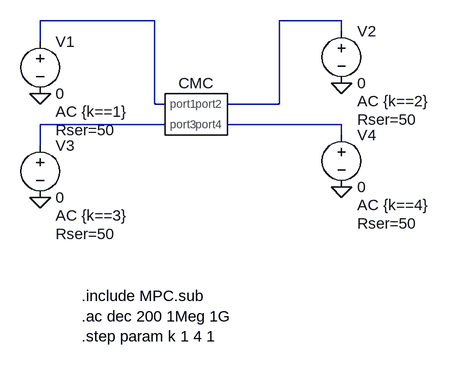
[diagram p0: schematic MPC_testbench.asc]
MPC_testbench.asc, the LTspice schematic file:
Version 4.1
SHEET 1 944 680
WIRE 496 -32 320 -32
WIRE 784 -32 688 -32
WIRE 784 -16 784 -32
WIRE 320 0 320 -32
WIRE 496 96 496 -32
WIRE 512 96 496 96
WIRE 688 96 688 -32
WIRE 688 96 608 96
WIRE 512 128 320 128
WIRE 784 128 608 128
WIRE 784 144 784 128
WIRE 320 160 320 128
FLAG 320 80 0
FLAG 784 64 0
FLAG 320 240 0
FLAG 784 224 0
SYMBOL voltage 320 -16 R0
WINDOW 123 24 124 Left 2
WINDOW 39 24 152 Left 2
SYMATTR InstName V1
SYMATTR Value 0
SYMATTR Value2 AC {k==1}
SYMATTR SpiceLine Rser=50
SYMBOL voltage 784 -32 R0
WINDOW 123 24 124 Left 2
WINDOW 39 24 152 Left 2
SYMATTR InstName V2
SYMATTR Value 0
SYMATTR Value2 AC {k==2}
SYMATTR SpiceLine Rser=50
SYMBOL voltage 320 144 R0
WINDOW 123 24 124 Left 2
WINDOW 39 24 152 Left 2
SYMATTR InstName V3
SYMATTR Value 0
SYMATTR Value2 AC {k==3}
SYMATTR SpiceLine Rser=50
SYMBOL voltage 784 128 R0
WINDOW 123 24 124 Left 2
WINDOW 39 24 152 Left 2
SYMATTR InstName V4
SYMATTR Value 0
SYMATTR Value2 AC {k==4}
SYMATTR SpiceLine Rser=50
SYMBOL MPC 560 112 R0
SYMATTR InstName CMC
SYMATTR SpiceModel MPC
SYMATTR SpiceLine LC=1.31934e-05 CC=1e-14 RC=2336.9 LD=5.72264e-07 CD=5.62282e-13 RD=1269.4 CW=1.14048e-12 Lw=1e-12 Cwt=1e-15 Rw=1e+06 Rcr=50.9365 Ccr=7.04504e-13 Rrl=2311.47 Lrl=1.59245e-05 Cg=2.7001e-13 RDC=1e-06
SYMATTR Prefix X
TEXT 384 392 Left 2 !.include MPC.sub\n.ac dec 200 1Meg 1G\n.step param k 1 4 1

The netlist it stands for:
* MPC_testbench.asc
V1 N001 0 0 AC {k==1} Rser=50
V2 N002 0 0 AC {k==2} Rser=50
V3 N003 0 0 AC {k==3} Rser=50
V4 N004 0 0 AC {k==4} Rser=50
X§CMC N001 N002 N003 N004 MPC LC=1.31934e-05 CC=1e-14 RC=2336.9 LD=5.72264e-07 CD=5.62282e-13 RD=1269.4 CW=1.14048e-12 Lw=1e-12 Cwt=1e-15 Rw=1e+06 Rcr=50.9365 Ccr=7.04504e-13 Rrl=2311.47 Lrl=1.59245e-05 Cg=2.7001e-13 RDC=1e-06  ; pins port1 port2 port3 port4
.include MPC.sub
.ac dec 200 1Meg 1G
.step param k 1 4 1
.lib MPC.sub
.backanno
.end